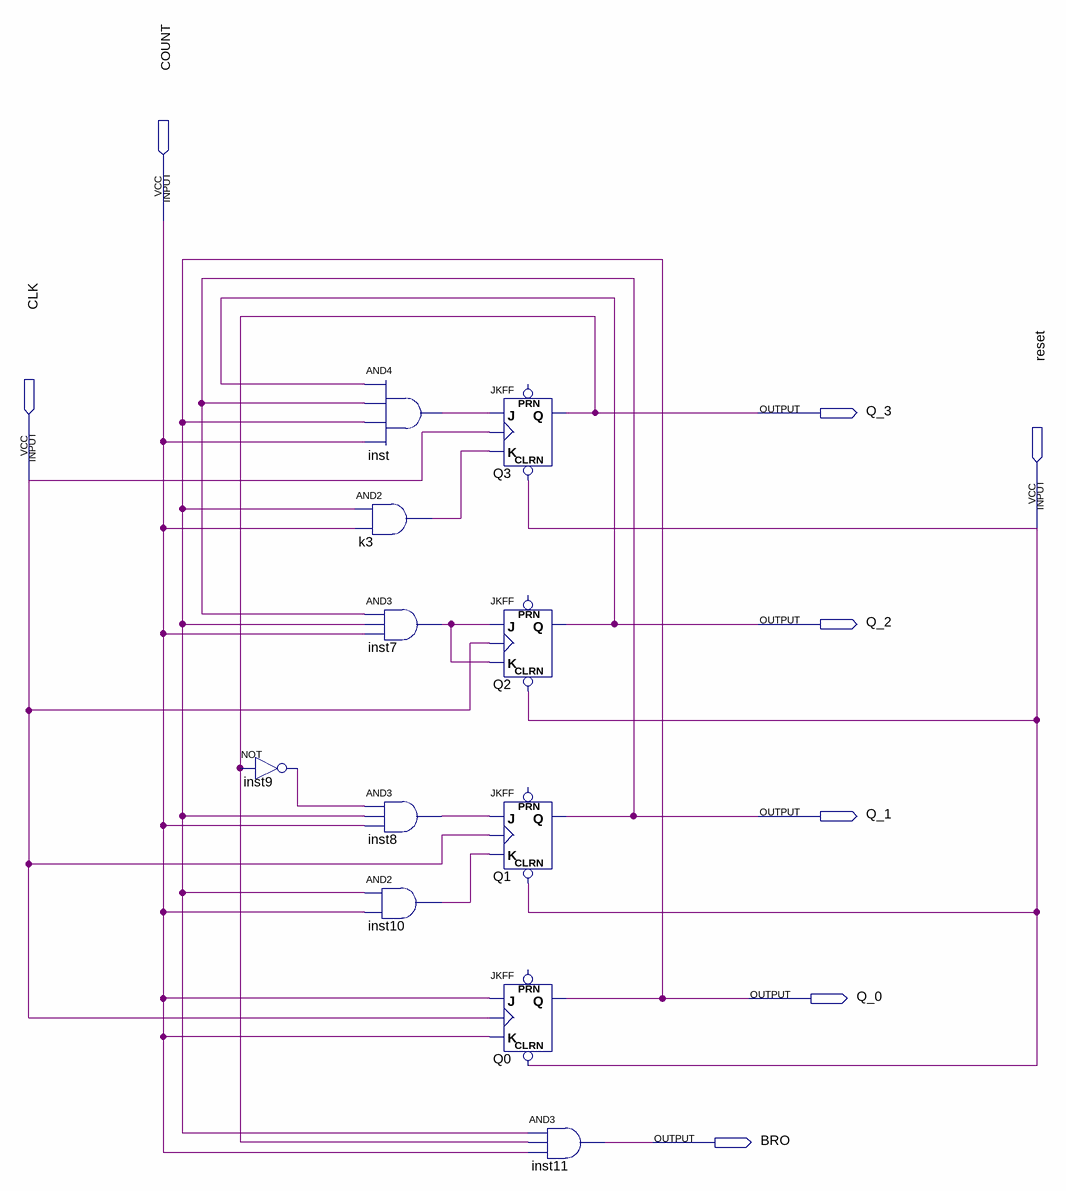
[diagram p0: schematic sheet]
// Quartus schematic BCD.bdf as structural Verilog: 11 symbols, 8 pins
module BCD (
  input  COUNT,
  input  CLK,
  input  reset,
  output Q_3,
  output Q_2,
  output Q_1,
  output Q_0,
  output BRO
);

  wire inst7_out, inst8_out, inst9_out, inst10_out, inst_out, k3_out;

  not inst9 (inst9_out, Q_3);
  and inst (inst_out, Q_2, Q_1, Q_0, COUNT);
  and k3 (k3_out, Q_0, COUNT);
  and inst7 (inst7_out, Q_1, Q_0, COUNT);
  and inst8 (inst8_out, inst9_out, Q_0, COUNT);
  and inst10 (inst10_out, Q_0, COUNT);
  JKFF Q3 (.CLRN(reset), .K(k3_out), .J(inst_out), .CLK(CLK), .Q(Q_3));  // open: PRN
  JKFF Q2 (.CLRN(reset), .K(inst7_out), .J(inst7_out), .CLK(CLK), .Q(Q_2));  // open: PRN
  JKFF Q1 (.CLRN(reset), .K(inst10_out), .J(inst8_out), .CLK(CLK), .Q(Q_1));  // open: PRN
  JKFF Q0 (.CLRN(reset), .K(COUNT), .J(COUNT), .CLK(CLK), .Q(Q_0));  // open: PRN
  and inst11 (BRO, Q_0, Q_3, COUNT);
endmodule
